# Altium schematic sheet STPMotorControl6_1.SchDoc
size A4; SheetNumber: 7; SheetTotal: 8
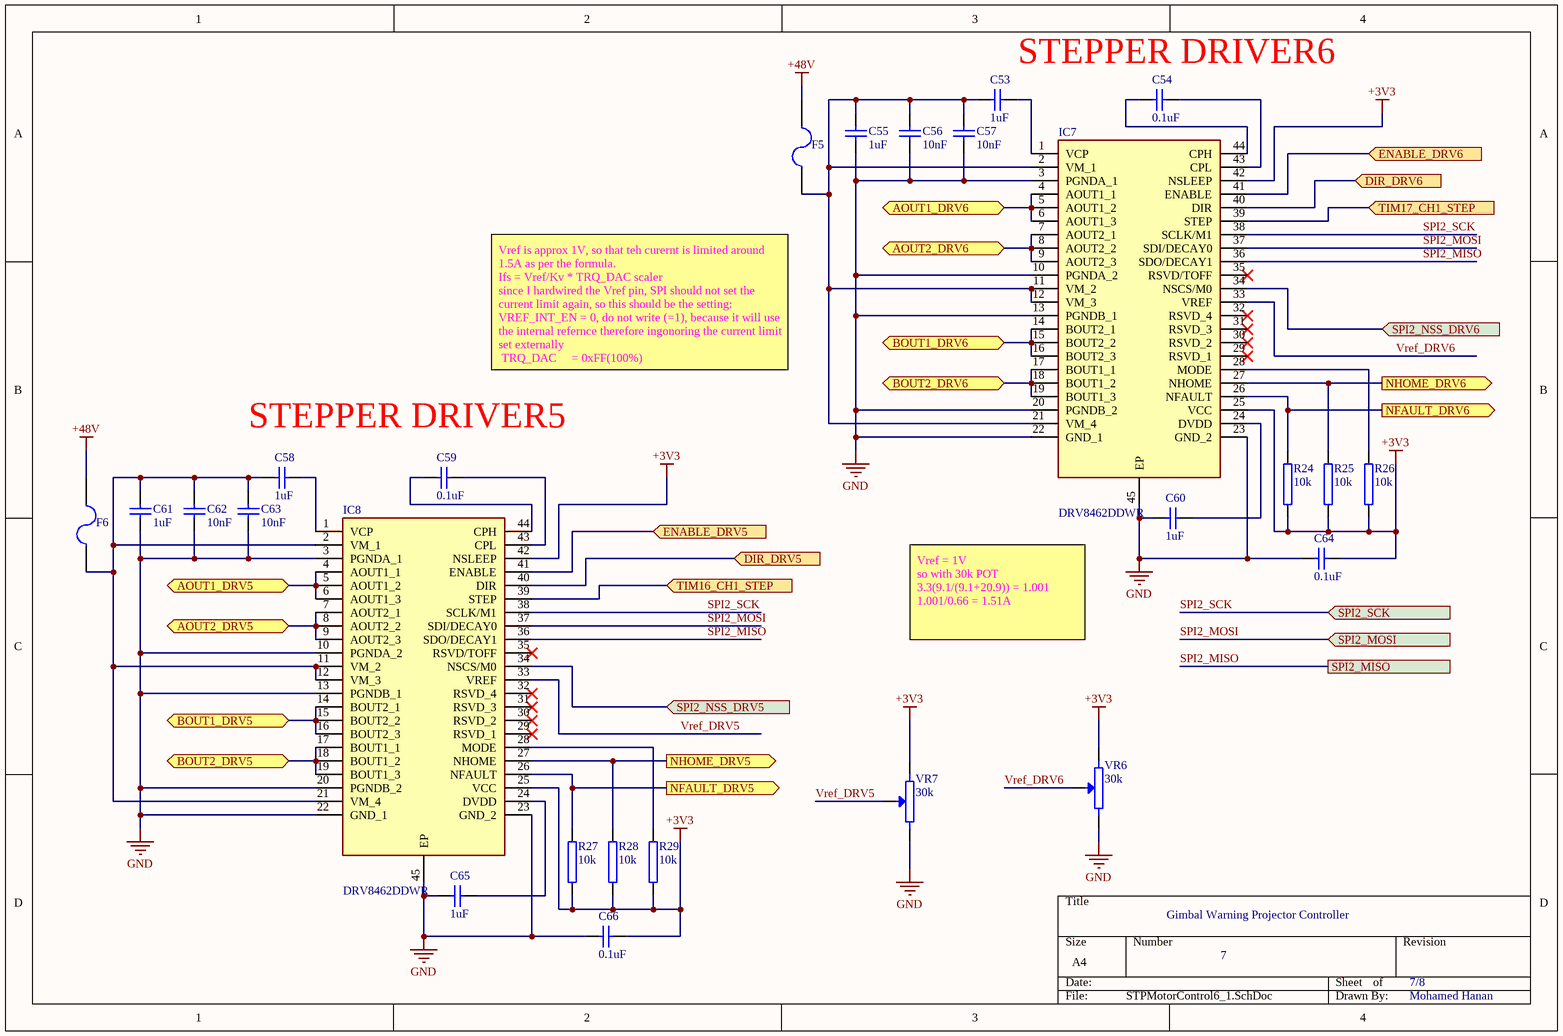
[diagram p0: STPMotorControl6_1.SchDoc]

## Parts
C53  1uF  [CAP_0805]
C54  0.1uF  [CAP_1206]
C55  1uF  [CAP_0805]
C56  10nF  [CAP_0805]
C57  10nF  [CAP_0805]
C58  1uF  [CAP_0805]
C59  0.1uF  [CAP_1206]
C60  1uF  [CAP_0805]
C61  1uF  [CAP_0805]
C62  10nF  [CAP_0805]
C63  10nF  [CAP_0805]
C64  0.1uF  [CAP_1206]
C65  1uF  [CAP_0805]
C66  0.1uF  [CAP_1206]
F5  1206L035/16YR  [MC36207]  (value not drawn)
F6  1206L035/16YR  [MC36207]  (value not drawn)
IC7  DRV8462DDWR  [SOP64P810X120-45N]
IC8  DRV8462DDWR  [SOP64P810X120-45N]
R24  10k  [RES_0805]
R25  10k  [RES_0805]
R26  10k  [RES_0805]
R27  10k  [RES_0805]
R28  10k  [RES_0805]
R29  10k  [RES_0805]
VR6  30k  [3362S]
VR7  30k  [3362S]

## Ports
AOUT1_DRV5 (bidir, see STPMotorConnections[2C], STPMotorControl7_1[1C]), AOUT1_DRV6 (bidir, see STPMotorConnections[2D], STPMotorControl7_1[1D]), AOUT2_DRV5 (bidir, see STPMotorConnections[2C], STPMotorControl7_1[1C]), AOUT2_DRV6 (bidir, see STPMotorConnections[2D], STPMotorControl7_1[1D]), BOUT1_DRV5 (bidir, see STPMotorConnections[2C], STPMotorControl7_1[1C]), BOUT1_DRV6 (bidir, see STPMotorConnections[2D], STPMotorControl7_1[1D]), BOUT2_DRV5 (bidir, see STPMotorConnections[2D], STPMotorControl7_1[1C]), BOUT2_DRV6 (bidir, see STPMotorConnections[2D], STPMotorControl7_1[1D]), DIR_DRV5 (in, see STPMotorConnections[1D], STPMotorControl_1[3D]), DIR_DRV6 (in, see STPMotorConnections[1D], STPMotorControl_1[3D]), ENABLE_DRV5 (in, see STPMotorConnections[1D]), ENABLE_DRV6 (in, see STPMotorConnections[1D]), NFAULT_DRV5 (out, see STPMotorConnections[2D], STPMotorControl_1[1B]), NFAULT_DRV6 (out, see STPMotorConnections[2D], STPMotorControl_1[1C]), NHOME_DRV5 (out, see STPMotorConnections[2D], STPMotorControl_1[1C]), NHOME_DRV6 (out, see STPMotorConnections[2D], STPMotorControl_1[1C]), SPI2_MISO (see STPMotorConnections[1D], STPMotorControl4_1[4C], STPMotorControl5_1[4C], STPMotorControl_1[3C]), SPI2_MOSI (in, see STPMotorConnections[1D], STPMotorControl4_1[4C], STPMotorControl5_1[4C], STPMotorControl_1[3B]), SPI2_NSS_DRV5 (in, see STPMotorConnections[2D], STPMotorControl_1[3A]), SPI2_NSS_DRV6 (in, see STPMotorConnections[2D], STPMotorControl_1[3C]), SPI2_SCK (in, see STPMotorConnections[1D], STPMotorControl4_1[4C], STPMotorControl5_1[4C], STPMotorControl_1[3B]), TIM16_CH1_STEP (in, see STPMotorConnections[1D], STPMotorControl_1[3A]), TIM17_CH1_STEP (in, see STPMotorConnections[1D], STPMotorControl_1[3A])

## Nets
+3V3: C64.1 C66.1 IC7.25(VCC) IC7.42(NSLEEP) IC8.25(VCC) IC8.42(NSLEEP) R24.1 R25.1 R26.1 R27.1 R28.1 R29.1 VR6.1(TOP) VR7.1(TOP)
+48V: F5.2 F6.2
GND: C55.1 C56.1 C57.1 C60.2 C61.1 C62.1 C63.1 C64.2 C65.2 C66.2 IC7.3(PGNDA_1) IC7.10(PGNDA_2) IC7.13(PGNDB_1) IC7.20(PGNDB_2) IC7.22(GND_1) IC7.23(GND_2) IC7.45(EP) IC8.3(PGNDA_1) IC8.10(PGNDA_2) IC8.13(PGNDB_1) IC8.20(PGNDB_2) IC8.22(GND_1) IC8.23(GND_2) IC8.45(EP) VR6.2(BOT) VR7.2(BOT)
AOUT1_DRV5: IC8.4(AOUT1_1) IC8.5(AOUT1_2) IC8.6(AOUT1_3) ; port AOUT1_DRV5
AOUT1_DRV6: IC7.4(AOUT1_1) IC7.5(AOUT1_2) IC7.6(AOUT1_3) ; port AOUT1_DRV6
AOUT2_DRV5: IC8.7(AOUT2_1) IC8.8(AOUT2_2) IC8.9(AOUT2_3) ; port AOUT2_DRV5
AOUT2_DRV6: IC7.7(AOUT2_1) IC7.8(AOUT2_2) IC7.9(AOUT2_3) ; port AOUT2_DRV6
BOUT1_DRV5: IC8.14(BOUT2_1) IC8.15(BOUT2_2) IC8.16(BOUT2_3) ; port BOUT1_DRV5
BOUT1_DRV6: IC7.14(BOUT2_1) IC7.15(BOUT2_2) IC7.16(BOUT2_3) ; port BOUT1_DRV6
BOUT2_DRV5: IC8.17(BOUT1_1) IC8.18(BOUT1_2) IC8.19(BOUT1_3) ; port BOUT2_DRV5
BOUT2_DRV6: IC7.17(BOUT1_1) IC7.18(BOUT1_2) IC7.19(BOUT1_3) ; port BOUT2_DRV6
DIR_DRV5: IC8.40(DIR) ; port DIR_DRV5
DIR_DRV6: IC7.40(DIR) ; port DIR_DRV6
ENABLE_DRV5: IC8.41(ENABLE) ; port ENABLE_DRV5
ENABLE_DRV6: IC7.41(ENABLE) ; port ENABLE_DRV6
NFAULT_DRV5: IC8.26(NFAULT) R27.2 ; port NFAULT_DRV5
NFAULT_DRV6: IC7.26(NFAULT) R24.2 ; port NFAULT_DRV6
NHOME_DRV5: IC8.27(NHOME) R28.2 ; port NHOME_DRV5
NHOME_DRV6: IC7.27(NHOME) R25.2 ; port NHOME_DRV6
SPI2_MISO: IC7.36(SDO/DECAY1) IC8.36(SDO/DECAY1) ; port SPI2_MISO
SPI2_MOSI: IC7.37(SDI/DECAY0) IC8.37(SDI/DECAY0) ; port SPI2_MOSI
SPI2_NSS_DRV5: IC8.34(NSCS/M0) ; port SPI2_NSS_DRV5
SPI2_NSS_DRV6: IC7.34(NSCS/M0) ; port SPI2_NSS_DRV6
SPI2_SCK: IC7.38(SCLK/M1) IC8.38(SCLK/M1) ; port SPI2_SCK
TIM16_CH1_STEP: IC8.39(STEP) ; port TIM16_CH1_STEP
TIM17_CH1_STEP: IC7.39(STEP) ; port TIM17_CH1_STEP
Vref_DRV5: IC8.33(VREF) VR7.W(TAP)
Vref_DRV6: IC7.33(VREF) VR6.W(TAP)
NetC53_1: C53.1 IC7.1(VCP)
NetC53_2: C53.2 C55.2 C56.2 C57.2 F5.1 IC7.2(VM_1) IC7.11(VM_2) IC7.12(VM_3) IC7.21(VM_4)
NetC54_1: C54.1 IC7.43(CPL)
NetC54_2: C54.2 IC7.44(CPH)
NetC58_1: C58.1 IC8.1(VCP)
NetC58_2: C58.2 C61.2 C62.2 C63.2 F6.1 IC8.2(VM_1) IC8.11(VM_2) IC8.12(VM_3) IC8.21(VM_4)
NetC59_1: C59.1 IC8.43(CPL)
NetC59_2: C59.2 IC8.44(CPH)
NetC60_1: C60.1 IC7.24(DVDD)
NetC65_1: C65.1 IC8.24(DVDD)
NetIC7_28: IC7.28(MODE) R26.2
NetIC8_28: IC8.28(MODE) R29.2

Not connected (* = marked no-connect by the designer): IC7 29(RSVD_1)* 30(RSVD_2)* 31(RSVD_3)* 32(RSVD_4)* 35(RSVD/TOFF)*; IC8 29(RSVD_1)* 30(RSVD_2)* 31(RSVD_3)* 32(RSVD_4)* 35(RSVD/TOFF)*

## Notes on the sheet
- STEPPER DRIVER6
- Vref is approx 1V, so that teh curernt is limited around 1.5A as per the formula.
  Ifs = Vref/Kv * TRQ_DAC scaler
  since I hardwired the Vref pin, SPI should not set the current limit again, so this should be the setting:
  VREF_INT_EN = 0, do not write (=1), because it will use the internal refernce therefore ingonoring the current limit set externally
  TRQ_DAC     = 0xFF(100%)
- STEPPER DRIVER5
- Vref = 1V
  so with 30k POT
  3.3(9.1/(9.1+20.9)) = 1.001
  1.001/0.66 = 1.51A
- Gimbal Warning Projector Controller
- 7
- 7/8
- Mohamed Hanan

## Library data of the parts
C53 C55-C58 C60-C63 C65 = CAPN 0805: Non Polarized Capacitor, SMD, 0805
C54 C59 C64 C66 = CAPN 1206: Non Polarized Capacitor, SMD, 1206
F5 F6 = 1206L035/16YR: Fuse, PTC Reset, 350mA Hold, 750mA Tripping, 16v; Supplier 1: Element14; Supplier Part Number 1: 1822203
IC7 IC8 = DRV8462DDWR: Integrated Circuit; Manufacturer_Name: Texas Instruments; Datasheet Link: https://www.ti.com/lit/gpn/drv8462; Height: 1.2mm; Manufacturer_Part_Number: DRV8462DDWR; Mouser Part Number: 595-DRV8462DDWR; Mouser Price/Stock: https://www.mouser.co.uk/ProductDetail/Texas-Instruments/DRV8462DDWR?qs=rQFj71Wb1eVexvYNsDfnvA%3D%3D; Arrow Part Number: DRV8462DDWR; Arrow Price/Stock: https://www.arrow.com/en/products/drv8462ddwr/texas-instruments?utm_currency=USD&region=nac
R24-R29 = Resistor 0805: Resistor, SMD, 0805
VR6 VR7 = 3362S-1-202LF: 3362S Series, 1/4 ” Square  Potentiometer, 2k, 10%, 0.5 Watts, 1Turn; Supplier 1: Farnell; Supplier Part Number 1: 2321842